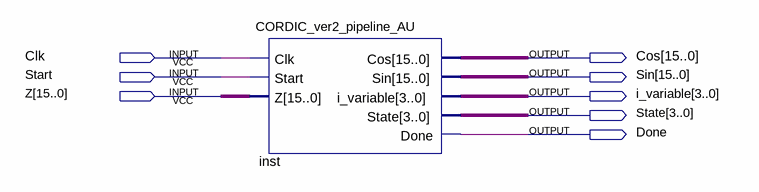
[diagram p0: schematic sheet]
// Quartus schematic CORDIC_ver2_pipeline_AU_test.bdf as structural Verilog: 1 symbols, 8 pins
module CORDIC_ver2_pipeline_AU_test (
  input  Clk,
  input  Start,
  input  [15:0] Z,
  output [15:0] Cos,
  output [15:0] Sin,
  output [3:0] i_variable,
  output [3:0] State,
  output Done
);

  CORDIC_ver2_pipeline_AU inst (
    .Clk(Clk), .Start(Start), .Z(Z), .Cos(Cos), .Sin(Sin), .i_variable(i_variable), .State(State), .Done(Done));
endmodule
